# Altium schematic sheet TOP.SchDoc: TAXIMETRE_PCB_MAIN
size A4; Author: Burak YALIM; CompanyName: BARFAS; DrawnBy: Burak YALIM; DocumentNumber: 0; SheetNumber: 1; SheetTotal: 12
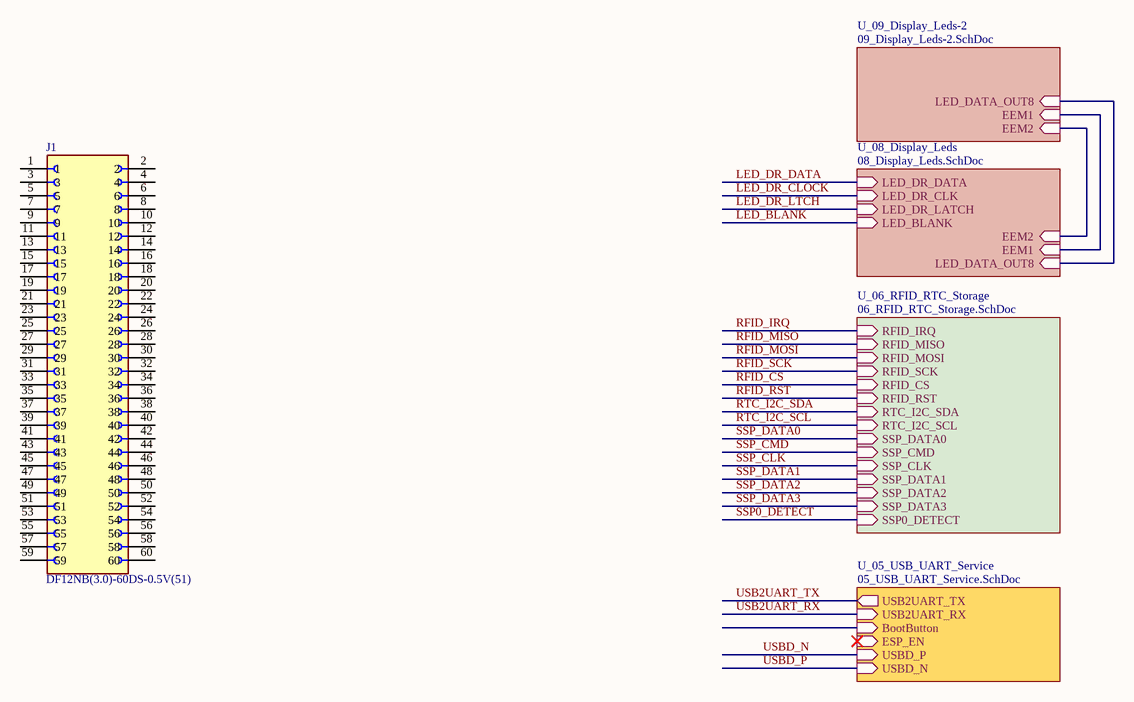
[diagram p0: TOP.SchDoc]

## Parts
J1  DF12NB(3.0)-60DS-0.5V(51)  [HRS_DF12NB(3.0)-60DS-0.5V(51)]

## Sub-sheets
U_05_USB_UART_Service = 05_USB_UART_Service.SchDoc: USB2UART_TX (out), USB2UART_RX (in), BootButton (in), ESP_EN (in), USBD_P (in), USBD_N (in)
U_06_RFID_RTC_Storage = 06_RFID_RTC_Storage.SchDoc: RFID_IRQ (in), RFID_MISO (in), RFID_MOSI (in), RFID_SCK (in), RFID_CS (in), RFID_RST (in), RTC_I2C_SDA (in), RTC_I2C_SCL (in), SSP_DATA0 (in), SSP_CMD (in), SSP_CLK (in), SSP_DATA1 (in), SSP_DATA2 (in), SSP_DATA3 (in), SSP0_DETECT (in)
U_08_Display_Leds = 08_Display_Leds.SchDoc: LED_DR_DATA (in), LED_DR_CLK (in), LED_DR_LATCH (in), LED_BLANK (in), LED_DATA_OUT8 (in), EEM1 (in), EEM2 (in)
U_09_Display_Leds-2 = 09_Display_Leds-2.SchDoc: LED_DATA_OUT8 (in), EEM1 (in), EEM2 (in)

## Nets
LED_BLANK: sheet U_08_Display_Leds/LED_BLANK
LED_DR_CLOCK: sheet U_08_Display_Leds/LED_DR_CLK
LED_DR_DATA: sheet U_08_Display_Leds/LED_DR_DATA
LED_DR_LTCH: sheet U_08_Display_Leds/LED_DR_LATCH
RFID_CS: sheet U_06_RFID_RTC_Storage/RFID_CS
RFID_IRQ: sheet U_06_RFID_RTC_Storage/RFID_IRQ
RFID_MISO: sheet U_06_RFID_RTC_Storage/RFID_MISO
RFID_MOSI: sheet U_06_RFID_RTC_Storage/RFID_MOSI
RFID_RST: sheet U_06_RFID_RTC_Storage/RFID_RST
RFID_SCK: sheet U_06_RFID_RTC_Storage/RFID_SCK
RTC_I2C_SCL: sheet U_06_RFID_RTC_Storage/RTC_I2C_SCL
RTC_I2C_SDA: sheet U_06_RFID_RTC_Storage/RTC_I2C_SDA
SSP0_DETECT: sheet U_06_RFID_RTC_Storage/SSP0_DETECT
SSP_CLK: sheet U_06_RFID_RTC_Storage/SSP_CLK
SSP_CMD: sheet U_06_RFID_RTC_Storage/SSP_CMD
SSP_DATA0: sheet U_06_RFID_RTC_Storage/SSP_DATA0
SSP_DATA1: sheet U_06_RFID_RTC_Storage/SSP_DATA1
SSP_DATA2: sheet U_06_RFID_RTC_Storage/SSP_DATA2
SSP_DATA3: sheet U_06_RFID_RTC_Storage/SSP_DATA3
USB2UART_RX: sheet U_05_USB_UART_Service/USB2UART_RX
USB2UART_TX: sheet U_05_USB_UART_Service/USB2UART_TX
USBD_N: sheet U_05_USB_UART_Service/USBD_P
USBD_P: sheet U_05_USB_UART_Service/USBD_N
(unnamed): sheet U_08_Display_Leds/LED_DATA_OUT8, sheet U_09_Display_Leds-2/LED_DATA_OUT8
(unnamed): sheet U_08_Display_Leds/EEM1, sheet U_09_Display_Leds-2/EEM1
(unnamed): sheet U_08_Display_Leds/EEM2, sheet U_09_Display_Leds-2/EEM2

Not connected (* = marked no-connect by the designer): J1 1 2 3 4 5 6 7 8 9 10 11 12 13 14 15 16 17 18 19 20 21 22 23 24 25 26 27 28 29 30 31 32 33 34 35 36 37 38 39 40 41 42 43 44 45 46 47 48 49 50 51 52 53 54 55 56 57 58 59 60

## Notes on the sheet
- Title
- Size:
- Date:
- A4
- Drawn By:
- Number:
- Revision:
- File:

## Library data of the parts
J1 = DF12NB(3.0)-60DS-0.5V(51): 60 Position Connector Receptacle, Center Strip Contacts Surface Mount Gold; MF: Hirose Electric Co Ltd; SnapEDA_Link: https://www.snapeda.com/parts/DF12NB(3.0)-60DS-0.5V(51)/Hirose/view-part/?ref=snap; Package: None; Value: *; MP: DF12NB(3.0)-60DS-0.5V(51); Check_prices: https://www.snapeda.com/parts/DF12NB(3.0)-60DS-0.5V(51)/Hirose/view-part/?ref=eda